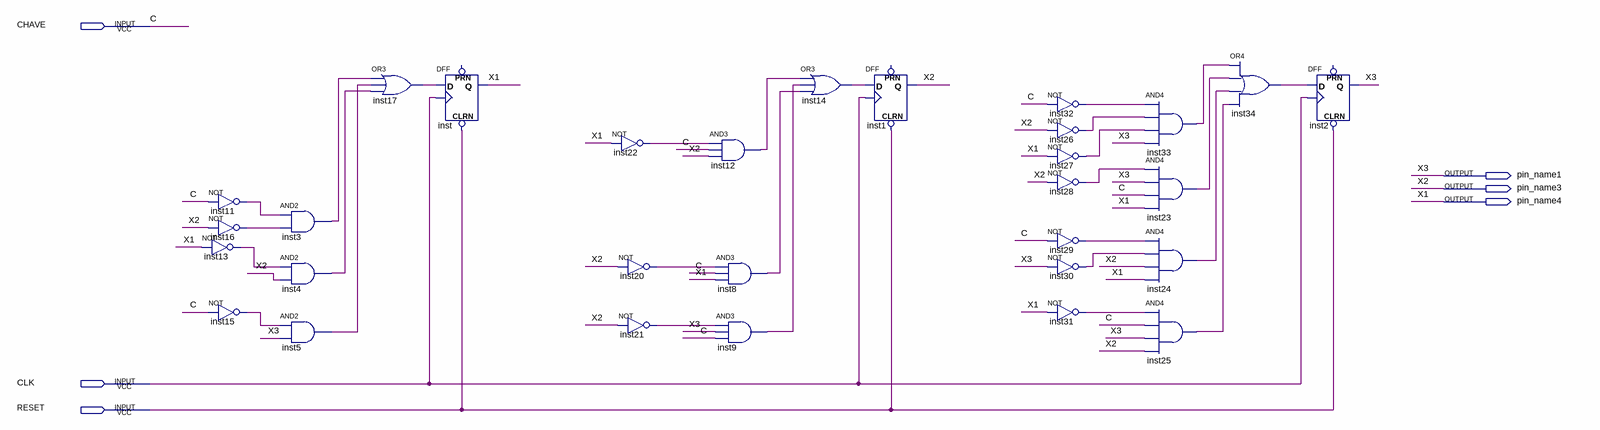
[diagram p0: schematic sheet]
// Quartus schematic Detector_Sequencia.bdf as structural Verilog: 30 symbols, 6 pins
module Detector_Sequencia (
  input  CHAVE,
  input  CLK,
  input  RESET,
  output pin_name1,
  output pin_name3,
  output pin_name4
);

  wire inst3_out, inst4_out, inst5_out, inst8_out, inst9_out, inst11_out, inst12_out, inst13_out, inst14_out,
       inst15_out, inst16_out, inst17_out, inst20_out, inst21_out, inst22_out, inst23_out, inst24_out,
       inst25_out, inst26_out, inst27_out, inst28_out, inst29_out, inst30_out, inst31_out, inst32_out,
       inst33_out, inst34_out;

  not inst11 (inst11_out, CHAVE);
  not inst16 (inst16_out, pin_name3);
  not inst13 (inst13_out, pin_name4);
  not inst15 (inst15_out, CHAVE);
  and inst3 (inst3_out, inst11_out, inst16_out);
  and inst4 (inst4_out, inst13_out, pin_name3);
  and inst5 (inst5_out, inst15_out, pin_name1);
  or inst17 (inst17_out, inst3_out, inst5_out, inst4_out);
  DFF inst (.CLRN(RESET), .CLK(CLK), .D(inst17_out), .Q(pin_name4));  // open: PRN
  not inst22 (inst22_out, pin_name4);
  not inst20 (inst20_out, pin_name3);
  not inst21 (inst21_out, pin_name3);
  and inst12 (inst12_out, inst22_out, CHAVE, pin_name3);
  and inst8 (inst8_out, inst20_out, CHAVE, pin_name4);
  and inst9 (inst9_out, inst21_out, pin_name1, CHAVE);
  or inst14 (inst14_out, inst12_out, inst9_out, inst8_out);
  DFF inst1 (.CLRN(RESET), .CLK(CLK), .D(inst14_out), .Q(pin_name3));  // open: PRN
  not inst32 (inst32_out, CHAVE);
  not inst26 (inst26_out, pin_name3);
  not inst27 (inst27_out, pin_name4);
  not inst28 (inst28_out, pin_name3);
  not inst29 (inst29_out, CHAVE);
  not inst30 (inst30_out, pin_name1);
  not inst31 (inst31_out, pin_name4);
  and inst33 (inst33_out, inst32_out, inst26_out, inst27_out, pin_name1);
  and inst23 (inst23_out, inst28_out, pin_name1, CHAVE, pin_name4);
  and inst24 (inst24_out, inst29_out, inst30_out, pin_name3, pin_name4);
  and inst25 (inst25_out, inst31_out, CHAVE, pin_name1, pin_name3);
  or inst34 (inst34_out, inst33_out, inst23_out, inst24_out, inst25_out);
  DFF inst2 (.CLRN(RESET), .CLK(CLK), .D(inst34_out), .Q(pin_name1));  // open: PRN

  // Other names for the same wires on the sheet: C = CHAVE; X1 = pin_name4; X2 = pin_name3; X3 = pin_name1
endmodule
